# Altium schematic sheet AVault.SchDoc
size A; SheetNumber: 1; SheetTotal: 5
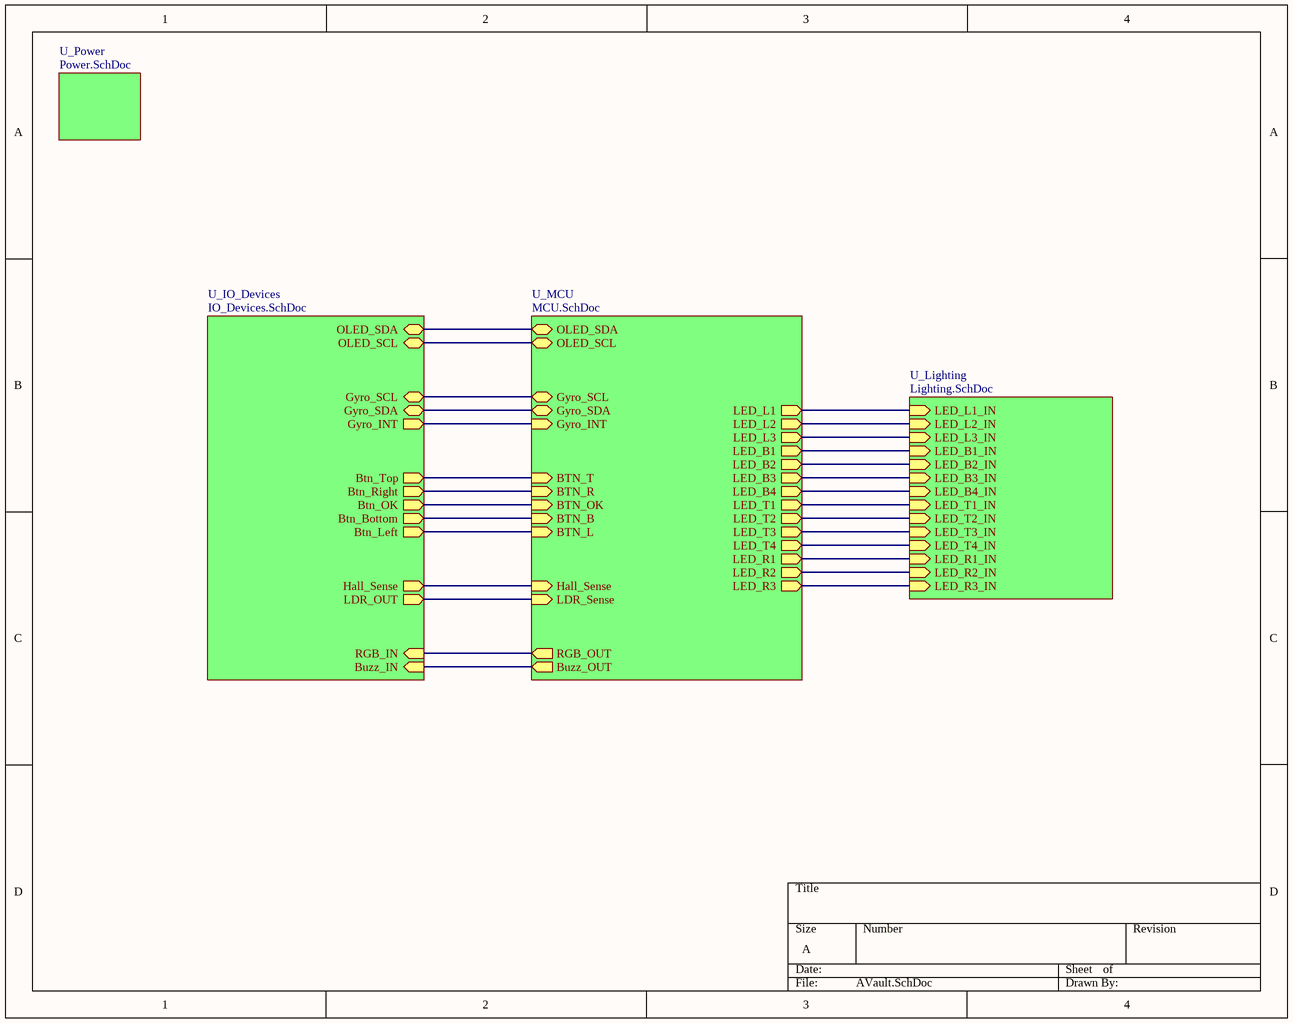
[diagram p0: AVault.SchDoc]

## Sub-sheets
U_IO_Devices = IO_Devices.SchDoc: OLED_SDA (bidir), OLED_SCL (bidir), Gyro_SCL (bidir), Gyro_SDA (bidir), Gyro_INT (out), Btn_Top (out), Btn_Right (out), Btn_OK (out), Btn_Bottom (out), Btn_Left (out), Hall_Sense (out), LDR_OUT (out), RGB_IN (in), Buzz_IN (in)
U_Lighting = Lighting.SchDoc: LED_L1_IN (in), LED_L2_IN (in), LED_L3_IN (in), LED_R1_IN (in), LED_R2_IN (in), LED_R3_IN (in), LED_B1_IN (in), LED_B2_IN (in), LED_B3_IN (in), LED_B4_IN (in), LED_T1_IN (in), LED_T2_IN (in), LED_T4_IN (in), LED_T3_IN (in)
U_MCU = MCU.SchDoc: OLED_SDA (bidir), OLED_SCL (bidir), Gyro_SDA (bidir), Gyro_SCL (bidir), LDR_Sense (in), LED_B3 (out), LED_B2 (out), LED_B1 (out), BTN_B (in), BTN_OK (in), BTN_T (in), BTN_R (in), BTN_L (in), LED_L3 (out), LED_L2 (out), LED_L1 (out), LED_T1 (out), LED_T2 (out), LED_T3 (out), LED_T4 (out), LED_R2 (out), LED_R3 (out), LED_R1 (out), RGB_OUT (out), Buzz_OUT (out), Hall_Sense (in), LED_B4 (out), Gyro_INT (in)
U_Power = Power.SchDoc: no entries

## Nets
(unnamed): sheet U_MCU/OLED_SDA, sheet U_IO_Devices/OLED_SDA
(unnamed): sheet U_MCU/OLED_SCL, sheet U_IO_Devices/OLED_SCL
(unnamed): sheet U_MCU/Gyro_SDA, sheet U_IO_Devices/Gyro_SDA
(unnamed): sheet U_MCU/Gyro_SCL, sheet U_IO_Devices/Gyro_SCL
(unnamed): sheet U_MCU/LDR_Sense, sheet U_IO_Devices/LDR_OUT
(unnamed): sheet U_MCU/LED_B3, sheet U_Lighting/LED_B3_IN
(unnamed): sheet U_MCU/LED_B2, sheet U_Lighting/LED_B2_IN
(unnamed): sheet U_MCU/LED_B1, sheet U_Lighting/LED_B1_IN
(unnamed): sheet U_MCU/BTN_B, sheet U_IO_Devices/Btn_Bottom
(unnamed): sheet U_MCU/BTN_OK, sheet U_IO_Devices/Btn_OK
(unnamed): sheet U_MCU/BTN_T, sheet U_IO_Devices/Btn_Top
(unnamed): sheet U_MCU/BTN_R, sheet U_IO_Devices/Btn_Right
(unnamed): sheet U_MCU/BTN_L, sheet U_IO_Devices/Btn_Left
(unnamed): sheet U_MCU/LED_L3, sheet U_Lighting/LED_L3_IN
(unnamed): sheet U_MCU/LED_L2, sheet U_Lighting/LED_L2_IN
(unnamed): sheet U_MCU/LED_L1, sheet U_Lighting/LED_L1_IN
(unnamed): sheet U_MCU/LED_T1, sheet U_Lighting/LED_T1_IN
(unnamed): sheet U_MCU/LED_T2, sheet U_Lighting/LED_T2_IN
(unnamed): sheet U_MCU/LED_T3, sheet U_Lighting/LED_T3_IN
(unnamed): sheet U_MCU/LED_T4, sheet U_Lighting/LED_T4_IN
(unnamed): sheet U_MCU/LED_R2, sheet U_Lighting/LED_R2_IN
(unnamed): sheet U_MCU/LED_R3, sheet U_Lighting/LED_R3_IN
(unnamed): sheet U_MCU/LED_R1, sheet U_Lighting/LED_R1_IN
(unnamed): sheet U_MCU/RGB_OUT, sheet U_IO_Devices/RGB_IN
(unnamed): sheet U_MCU/Buzz_OUT, sheet U_IO_Devices/Buzz_IN
(unnamed): sheet U_MCU/Hall_Sense, sheet U_IO_Devices/Hall_Sense
(unnamed): sheet U_MCU/LED_B4, sheet U_Lighting/LED_B4_IN
(unnamed): sheet U_MCU/Gyro_INT, sheet U_IO_Devices/Gyro_INT